# Altium project Task_Tony.PrjPcb (part 7 of 8)

## Sheet 3G_Modem.SchDoc
size A4; DocumentNumber: 11; SheetNumber: 11; SheetTotal: 28
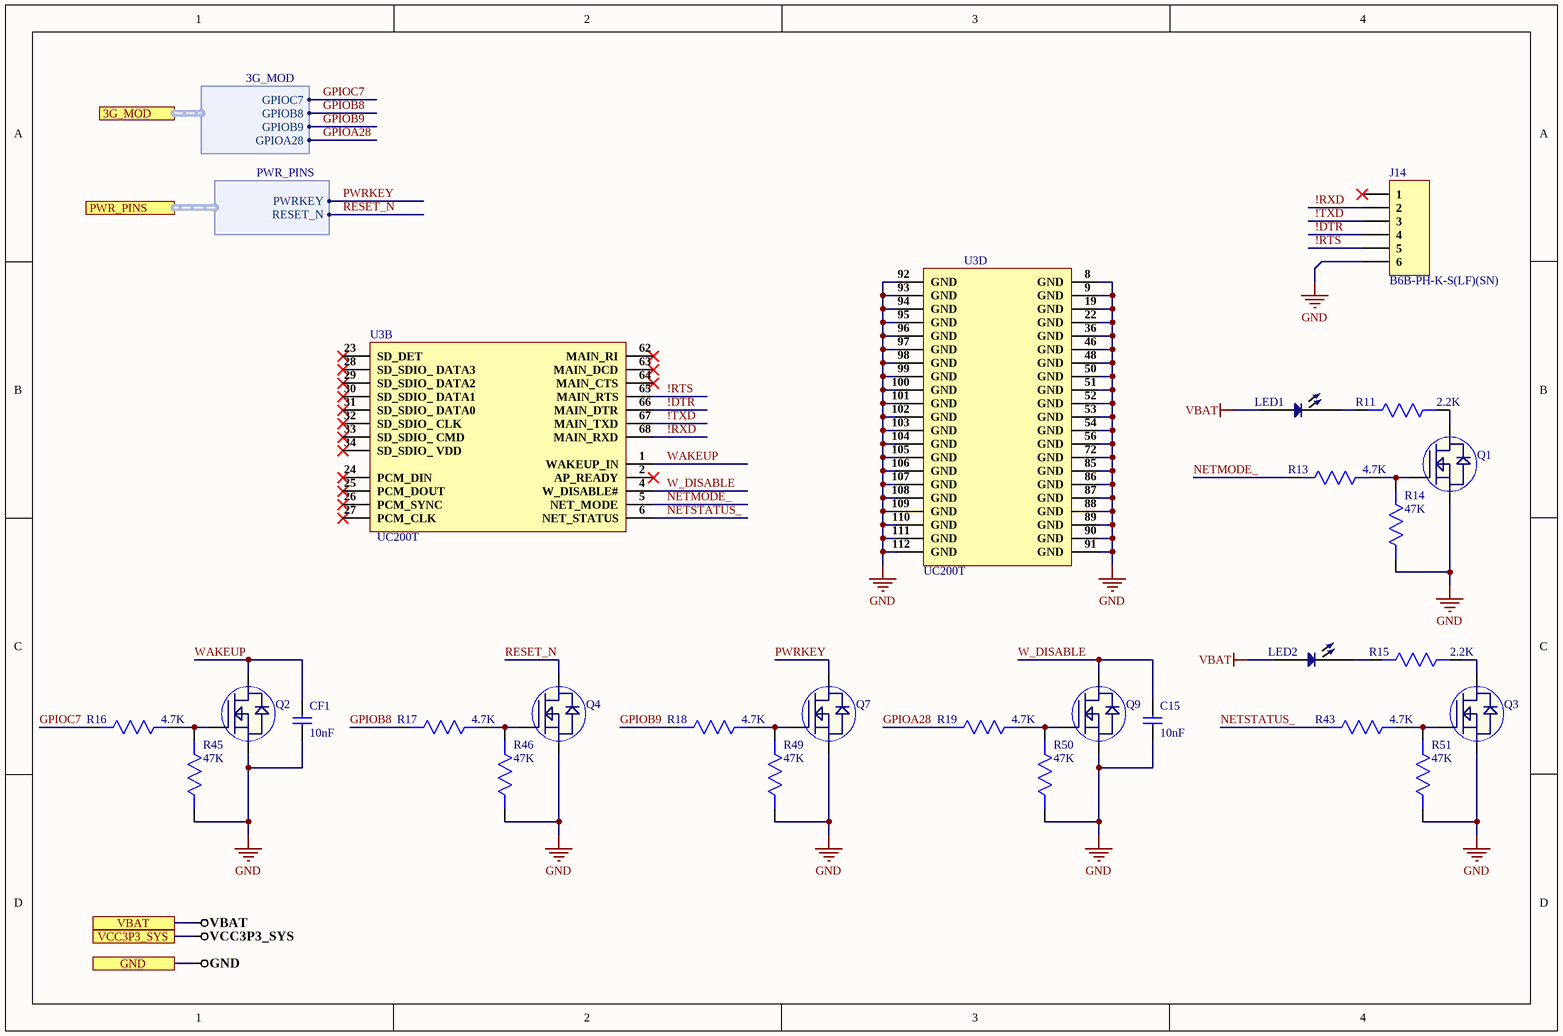
[diagram p27: 3G_Modem.SchDoc]

### Parts
C15  10nF  [Cap0603]
CF1  10nF  [Cap0603]
J14  B6B-PH-K-S(LF)(SN)  [B6B-PH-K-S(LF)(SN)]
LED1  LED Blue  [LED 0402]  (value not drawn)
LED2  LED Blue  [LED 0402]  (value not drawn)
Q1  BSS138LT1G  [SOT23-3]  (value not drawn)
Q2  BSS138LT1G  [SOT23-3]  (value not drawn)
Q3  BSS138LT1G  [SOT23-3]  (value not drawn)
Q4  BSS138LT1G  [SOT23-3]  (value not drawn)
Q7  BSS138LT1G  [SOT23-3]  (value not drawn)
Q9  BSS138LT1G  [SOT23-3]  (value not drawn)
R11  2.2K  [Res0603]
R13  4.7K  [Res0603]
R14  47K  [Res0603]
R15  2.2K  [Res0603]
R16  4.7K  [Res0603]
R17  4.7K  [Res0603]
R18  4.7K  [Res0603]
R19  4.7K  [Res0603]
R43  4.7K  [Res0603]
R45  47K  [Res0603]
R46  47K  [Res0603]
R49  47K  [Res0603]
R50  47K  [Res0603]
R51  47K  [Res0603]
U3  UC200T  [UC200T]  (parts B,D of 4)

### Ports
3G_MOD (harness 3G_MOD), GND, PWR_PINS (harness PWR_PINS), VBAT, VCC3P3_SYS

### Harnesses
PWR_PINS: PWRKEY, RESET_N
3G_MOD: GPIOC7, GPIOB8, GPIOB9, GPIOA28

### Nets
GND: C15.1 CF1.1 J14.6 Q1.2(S) Q2.2(S) Q3.2(S) Q4.2(S) Q7.2(S) Q9.2(S) R14.2 R45.2 R46.2 R49.2 R50.2 R51.2 U3.8(GND) U3.9(GND) U3.19(GND) U3.22(GND) U3.36(GND) U3.46(GND) U3.48(GND) U3.50(GND) U3.51(GND) U3.52(GND) U3.53(GND) U3.54(GND) U3.56(GND) U3.72(GND) U3.85(GND) U3.86(GND) U3.87(GND) U3.88(GND) U3.89(GND) U3.90(GND) U3.91(GND) U3.92(GND) U3.93(GND) U3.94(GND) U3.95(GND) U3.96(GND) U3.97(GND) U3.98(GND) U3.99(GND) U3.100(GND) U3.101(GND) U3.102(GND) U3.103(GND) U3.104(GND) U3.105(GND) U3.106(GND) U3.107(GND) U3.108(GND) U3.109(GND) U3.110(GND) U3.111(GND) U3.112(GND) ; port GND
VBAT: LED1.1 LED2.1 ; port VBAT
!DTR: J14.4 U3.66(MAIN_DTR)
!RTS: J14.5 U3.65(MAIN_RTS)
!RXD: J14.2 U3.68(MAIN_RXD)
!TXD: J14.3 U3.67(MAIN_TXD)
GPIOA28: R19.2 ; port 3G_MOD.GPIOA28  [project net 3G_MOD.GPIOA28]
GPIOB8: R17.2 ; port 3G_MOD.GPIOB8  [project net 3G_MOD.GPIOB8]
GPIOB9: R18.2 ; port 3G_MOD.GPIOB9  [project net 3G_MOD.GPIOB9]
GPIOC7: R16.2 ; port 3G_MOD.GPIOC7  [project net 3G_MOD.GPIOC7]
NETMODE_: R13.2 U3.5(NET_MODE)
NETSTATUS_: R43.2 U3.6(NET_STATUS)
PWRKEY: Q7.3(D) ; port PWR_PINS.PWRKEY
RESET_N: Q4.3(D) ; port PWR_PINS.RESET_N
W_DISABLE: C15.2 Q9.3(D) U3.4(W_DISABLE#)
WAKEUP: CF1.2 Q2.3(D) U3.1(WAKEUP_IN)
NetLED1_2: LED1.2 R11.2
NetLED2_2: LED2.2 R15.2
NetQ1_1: Q1.1(G) R13.1 R14.1
NetQ1_3: Q1.3(D) R11.1
NetQ2_1: Q2.1(G) R16.1 R45.1
NetQ3_1: Q3.1(G) R43.1 R51.1
NetQ3_3: Q3.3(D) R15.1
NetQ4_1: Q4.1(G) R17.1 R46.1
NetQ7_1: Q7.1(G) R18.1 R49.1
NetQ9_1: Q9.1(G) R19.1 R50.1

Not connected (* = marked no-connect by the designer): J14 1*; U3 2(AP_READY)* 23(SD_DET)* 24(PCM_DIN)* 25(PCM_DOUT)* 26(PCM_SYNC)* 27(PCM_CLK)* 28(SD_SDIO__DATA3)* 29(SD_SDIO__DATA2)* 30(SD_SDIO__DATA1)* 31(SD_SDIO__DATA0)* 32(SD_SDIO__CLK)* 33(SD_SDIO__CMD)* 34(SD_SDIO__VDD)* 62(MAIN_RI)* 63(MAIN_DCD)* 64(MAIN_CTS)*

### Library data of the parts
C15 = CC0603KRX7R9BB103: CAP CER 10000PF 50V X7R 0603; Manufacturer: Yageo; Material: Ceramic; Tolerance: 10%; Insulation Resistance: 100GR; Supplier 1: Digi-Key; Manufacturer Part Number: CC0603KRX7R9BB103; Stock 1: 8411467; Pricing 1: 1=0.1, 10=0.038, 100=0.0171, 500=0.01224, 1000=0.00962 (USD); Mount: Surface Mount; Case/Package: 0603; Number of Pins: 2; Case Code (Metric): 1608; Case Code (Imperial): 0603; Min Operating Temperature: -55°C; Max Operating Temperature: 125°C; Capacitance: 10nF; Dielectric: X7R; Voltage: 50V; Packaging: Tape and Reel; Voltage Rating: 50V; Voltage Rating (DC): 50V; Package Quantity: 1; Termination: SMD/SMT; Composition: Ceramic; Length: 1.6mm; Height: 0.8mm; Width: 0.031inch; Thickness: 0.035inch; Depth: 0.8mm; Radiation Hardening: No; REACH SVHC: No SVHC; Lead Free: Lead Free; Halogen Free: Halogen Free; ComponentLink1URL: http://www.farnell.com/datasheets/1734573.pdf?src-supplier=Element14; ComponentLink1Description: http://www.farnell.com/datasheets/1734573.pdf?src-supplier=Element14; ComponentLink2URL: http://www.yageo.com/documents/recent/UPY-GPHC_X7R_6.3V-to-50V_18.pdf?src-supplier=Digi-Key; ComponentLink2Description: http://www.yageo.com/documents/recent/UPY-GPHC_X7R_6.3V-to-50V_18.pdf?src-supplier=Digi-Key; ComponentLink3URL: http://www.farnell.com/datasheets/2167236.pdf?src-supplier=Mouser; ComponentLink3Description: http://www.farnell.com/datasheets/2167236.pdf?src-supplier=Mouser; ComponentLink4URL: http://www.farnell.com/datasheets/70765.pdf?src-supplier=Element14; ComponentLink4Description: http://www.farnell.com/datasheets/70765.pdf?src-supplier=Element14; ComponentLink5URL: http://www.yageo.com/documents/recent/UPY-GPHC_X7R_6.3V-to-50V_8.pdf?src-supplier=Avnet+Europe; ComponentLink5Description: http://www.yageo.com/documents/recent/UPY-GPHC_X7R_6.3V-to-50V_8.pdf?src-supplier=Avnet+Europe; ComponentLink6URL: http://www.farnell.com/datasheets/1489800.pdf?src-supplier=Element14; ComponentLink6Description: http://www.farnell.com/datasheets/1489800.pdf?src-supplier=Element14; ComponentLink7URL: https://www.verical.com/server-webapp/html/getDatasheet?partID=403582&src-supplier=Verical; ComponentLink7Description: https://www.verical.com/server-webapp/html/getDatasheet?partID=403582&src-supplier=Verical; Supplier Part Number 1: 311-1085-6-ND
CF1 = CC0603KRX7R9BB103: CAP CER 10000PF 50V X7R 0603; Manufacturer: Yageo; Tolerance: 10%; Insulation Resistance: 100GR; Supplier 1: Digi-Key; Manufacturer Part Number: CC0603KRX7R9BB103; Stock 1: 8411467; Pricing 1: 1=0.1, 10=0.038, 100=0.0171, 500=0.01224, 1000=0.00962 (USD); Mount: Surface Mount; Case/Package: 0603; Number of Pins: 2; Material: Ceramic; Case Code (Metric): 1608; Case Code (Imperial): 0603; Min Operating Temperature: -55°C; Max Operating Temperature: 125°C; Capacitance: 10nF; Dielectric: X7R; Voltage: 50V; Packaging: Tape and Reel; Voltage Rating: 50V; Voltage Rating (DC): 50V; Package Quantity: 1; Termination: SMD/SMT; Composition: Ceramic; Length: 1.6mm; Height: 0.8mm; Width: 0.031inch; Thickness: 0.035inch; Depth: 0.8mm; Radiation Hardening: No; REACH SVHC: No SVHC; Lead Free: Lead Free; Halogen Free: Halogen Free; ComponentLink1URL: http://www.farnell.com/datasheets/1734573.pdf?src-supplier=Element14; ComponentLink1Description: http://www.farnell.com/datasheets/1734573.pdf?src-supplier=Element14; ComponentLink2URL: http://www.yageo.com/documents/recent/UPY-GPHC_X7R_6.3V-to-50V_18.pdf?src-supplier=Digi-Key; ComponentLink2Description: http://www.yageo.com/documents/recent/UPY-GPHC_X7R_6.3V-to-50V_18.pdf?src-supplier=Digi-Key; ComponentLink3URL: http://www.farnell.com/datasheets/2167236.pdf?src-supplier=Mouser; ComponentLink3Description: http://www.farnell.com/datasheets/2167236.pdf?src-supplier=Mouser; ComponentLink4URL: http://www.farnell.com/datasheets/70765.pdf?src-supplier=Element14; ComponentLink4Description: http://www.farnell.com/datasheets/70765.pdf?src-supplier=Element14; ComponentLink5URL: http://www.yageo.com/documents/recent/UPY-GPHC_X7R_6.3V-to-50V_8.pdf?src-supplier=Avnet+Europe; ComponentLink5Description: http://www.yageo.com/documents/recent/UPY-GPHC_X7R_6.3V-to-50V_8.pdf?src-supplier=Avnet+Europe; ComponentLink6URL: http://www.farnell.com/datasheets/1489800.pdf?src-supplier=Element14; ComponentLink6Description: http://www.farnell.com/datasheets/1489800.pdf?src-supplier=Element14; ComponentLink7URL: https://www.verical.com/server-webapp/html/getDatasheet?partID=403582&src-supplier=Verical; ComponentLink7Description: https://www.verical.com/server-webapp/html/getDatasheet?partID=403582&src-supplier=Verical; Supplier Part Number 1: 311-1085-6-ND
J14 = B6B-PH-K-S(LF)(SN): CONN HEADER VERT 6POS 2MM; Manufacturer: JST; Current Rating: 2A; Number of Positions: 6; Insulation Resistance: 1MR; Working Voltage: 100V; Gender: Male; Contact Resistance: 20mR; Connector Type: Male Pin; Supplier 1: Digi-Key; Manufacturer Part Number: B6B-PH-K-S(LF)(SN); RoHS: Yes; Category: Connectors; Stock 1: 6509; Pricing 1: 1=0.33000, 10=0.31300, 100=0.21940, 500=0.18808, 1000=0.15674, 5000=0.13435, 10000=0.12539 (USD); Mount: Through Hole; Number of Pins: 6; Contact Material: Tin,Brass; Color: Natural; Contact Plating: Tin,Copper; Housing Material: Polyamide; Housing Color: White; Min Operating Temperature: -25°C; Max Operating Temperature: 85°C; Termination: Solder; Fastening Type: Detent; Number of Contacts: 6; Max Voltage Rating (AC): 100V; Number of Rows: 1; Packaging: Bulk; Number of Poles: 6; Voltage Rating (AC): 100V; Max Current Rating: 2A; Voltage Rating: 100V; Orientation: Straight; Length: 13.9mm; Width: 4.5mm; Height: 9.4mm; Pitch: 2mm; Contact Mating Length: 0.13inch; Depth: 4.5mm; Lead Pitch: 2mm; Lead Free: Lead Free; REACH SVHC: No SVHC; ComponentLink1URL: https://datasheet.ciiva.com/11747/0900766b8082f554-11747368.pdf?src-supplier=RSComponents; ComponentLink1Description: https://datasheet.ciiva.com/11747/0900766b8082f554-11747368.pdf?src-supplier=RSComponents; ComponentLink2URL: https://datasheet.ciiva.com/712/eph-712563.pdf?src-supplier=Digi-Key; ComponentLink2Description: https://datasheet.ciiva.com/712/eph-712563.pdf?src-supplier=Digi-Key; ComponentLink3URL: https://datasheet.ciiva.com/26894/getdatasheetpartid-639917-26894487.pdf?src-supplier=Verical; ComponentLink3Description: https://datasheet.ciiva.com/26894/getdatasheetpartid-639917-26894487.pdf?src-supplier=Verical; ComponentLink4URL: https://datasheet.ciiva.com/20207/523648-20207241.pdf?src-supplier=Rapid+Electronics; ComponentLink4Description: https://datasheet.ciiva.com/20207/523648-20207241.pdf?src-supplier=Rapid+Electronics; ComponentLink5URL: https://datasheet.ciiva.com/8052/80560-8052027.pdf?src-supplier=Element14; ComponentLink5Description: https://datasheet.ciiva.com/8052/80560-8052027.pdf?src-supplier=Element14; Supplier Part Number 1: 455-1708-ND
LED1 LED2 = APHHS1005QBC/D: LED BLUE CLEAR CHIP SMD 0402; Manufacturer: Kingbright; Lens Colour: Colorless; Forward Current: 20mA; Forward Voltage: 3.3V; Power Rating: 120mW; Luminous Intensity: 60mcd; Viewing Angle: 120°; Dominant Wavelength: 465nm; Supplier 1: Digi-Key; Manufacturer Part Number: APHHS1005QBC/D; Stock 1: 57149; Pricing 1: 1=0.58, 10=0.42, 25=0.3432, 100=0.2746, 250=0.23168, 500=0.19734, 1000=0.15444 (USD); Mount: Surface Mount; Case/Package: 0402; Colour: Blue; Case Code (Metric): 1005; Case Code (Imperial): 0402; Min Operating Temperature: -40°C; Max Operating Temperature: 85°C; Package Quantity: 2000; Illumination Colour: Blue; Packaging: Tape and Reel; Lens Style: Clear; Lens Transparency: Clear; Test Current: 20mA; Length: 1mm; Height: 0.6mm; Width: 0.5mm; Lead Free: Lead Free; ComponentLink1URL: http://www.mouser.com/ds/2/216/APHHS1005QBC-D-54846.pdf; ComponentLink1Description: http://www.mouser.com/ds/2/216/APHHS1005QBC-D-54846.pdf; ComponentLink2URL: http://www.kingbrightusa.com/images/catalog/SPEC/APHHS1005QBC-D.pdf; ComponentLink2Description: http://www.kingbrightusa.com/images/catalog/SPEC/APHHS1005QBC-D.pdf; Supplier Part Number 1: 754-1504-1-ND
Q1-Q4 Q7 Q9 = BSS138LT1G: MOSFET N-CH 50V 200MA SOT-23; Manufacturer: ON Semiconductor; Gate to Source Voltage (Vgs): 20V; Nominal Vgs: 1.5V; Rds On Max: 3.5R; Input Capacitance: 50pF; Number of Elements: 1; Max Power Dissipation: 225mW; Turn-Off Delay Time: 20ns; Element Configuration: Single; ComponentLink1URL: https://datasheet.ciiva.com/22641/1596366-22641636.pdf; ComponentLink1Description: https://datasheet.ciiva.com/22641/1596366-22641636.pdf; ComponentLink2URL: https://datasheet.ciiva.com/1190/1596366-1190137.pdf; ComponentLink2Description: https://datasheet.ciiva.com/1190/1596366-1190137.pdf; ComponentLink3URL: https://datasheet.ciiva.com/15198/getdatasheetpartid-110266-15198908.pdf; ComponentLink3Description: https://datasheet.ciiva.com/15198/getdatasheetpartid-110266-15198908.pdf; ComponentLink4URL: https://datasheet.ciiva.com/8115/bss138lt1-d-8115295.pdf; ComponentLink4Description: https://datasheet.ciiva.com/8115/bss138lt1-d-8115295.pdf; ComponentLink5URL: https://datasheet.ciiva.com/8115/bss138lt1-d-8115358.pdf; ComponentLink5Description: https://datasheet.ciiva.com/8115/bss138lt1-d-8115358.pdf; ComponentLink6URL: https://datasheet.ciiva.com/1190/1596366-1190136.pdf; ComponentLink6Description: https://datasheet.ciiva.com/1190/1596366-1190136.pdf; ComponentLink7URL: https://datasheet.ciiva.com/936/bss138lt1-d-936802.pdf; ComponentLink7Description: https://datasheet.ciiva.com/936/bss138lt1-d-936802.pdf; ComponentLink8URL: https://datasheet.ciiva.com/936/bss138lt1-d-936801.pdf; ComponentLink8Description: https://datasheet.ciiva.com/936/bss138lt1-d-936801.pdf; ComponentLink9URL: https://datasheet.ciiva.com/14553/70099493-14553829.pdf; ComponentLink9Description: https://datasheet.ciiva.com/14553/70099493-14553829.pdf; ComponentLink10URL: https://datasheet.ciiva.com/936/bss138lt1-d-936803.pdf; ComponentLink10Description: https://datasheet.ciiva.com/936/bss138lt1-d-936803.pdf; Supplier 1: Digi-Key; Manufacturer Part Number: BSS138LT1G; Stock 1: 1283212; Pricing 1: 1=0.27, 10=0.222, 100=0.1177, 500=0.07746, 1000=0.05267 (USD); Case/Package: SOT-23-3; Number of Pins: 3; Contact Plating: Tin,Matte; Min Operating Temperature: -55°C; Max Operating Temperature: 150°C; Continuous Drain Current (ID): 200mA; Package Quantity: 1; Packaging: Tape and Reel; Drain to Source Breakdown Voltage: 50V; Power Dissipation: 225mW; Drain to Source Resistance: 3.5R; Threshold Voltage: 1.5V; Turn-On Delay Time: 20ns; Voltage Rating (DC): 50V; Current Rating: 200mA; On-State Resistance: 3.5R; Length: 3.04mm; Height: 1.01mm; Width: 1.4mm; Radiation Hardening: No; REACH SVHC: No SVHC; Lead Free: Lead Free; Halogen Free: Halogen Free; ComponentLink11URL: http://www.onsemi.com/pub/Collateral/BSS138LT1-D.PDF?src-supplier=Digi-Key; ComponentLink11Description: http://www.onsemi.com/pub/Collateral/BSS138LT1-D.PDF?src-supplier=Digi-Key; ComponentLink12URL: http://www.farnell.com/datasheets/1596366.pdf?src-supplier=Element14; ComponentLink12Description: http://www.farnell.com/datasheets/1596366.pdf?src-supplier=Element14; ComponentLink13URL: http://www.alliedelec.com/m/d/b3c6fd7d92596813fe75d33dcbaaae90.pdf?src-supplier=Allied+Electronics; ComponentLink13Description: http://www.alliedelec.com/m/d/b3c6fd7d92596813fe75d33dcbaaae90.pdf?src-supplier=Allied+Electronics; ComponentLink14URL: https://www.verical.com/server-webapp/html/getDatasheet?partID=110266&src-supplier=Verical; ComponentLink14Description: https://www.verical.com/server-webapp/html/getDatasheet?partID=110266&src-supplier=Verical; ComponentLink15URL: http://www.onsemi.com/pub_link/Collateral/BSS138LT1-D.PDF?src-supplier=Avnet; ComponentLink15Description: http://www.onsemi.com/pub_link/Collateral/BSS138LT1-D.PDF?src-supplier=Avnet; Supplier Part Number 1: BSS138LT1GOSDKR-ND
R11 R15 = RC0603FR-072K2L: RES SMD 2.2K OHM 1% 1/10W 0603; Manufacturer: Yageo Phycomp; Temperature Coefficient: 100ppm/°C; Resistance: 2.2kR; Power Rating: 100mW; Voltage Rating (DC): 50V; Supplier 1: Digi-Key; Manufacturer Part Number: RC0603FR-072K2L; Stock 1: 10587920; Pricing 1: 1=0.1, 10=0.023, 100=0.0094, 1000=0.00421, 2500=0.00366 (USD); Mount: Surface Mount; Case/Package: 0603; Number of Pins: 2; Min Operating Temperature: -55°C; Max Operating Temperature: 155°C; Tolerance: 1%; Packaging: Cut Tape; Length: 1.6mm; Height: 0.45mm; Width: 800um; Depth: 0.8mm; REACH SVHC: No SVHC; Lead Free: Lead Free; Supplier Part Number 1: 311-2.20KHRCT-ND
R13 R16-R19 R43 = RC0603FR-074K7L: RES SMD 4.7K OHM 1% 1/10W 0603; Manufacturer: Yageo; Resistance: 4.7kR; Temperature Coefficient: 100ppm/°C; Power Rating: 100mW; Voltage Rating (DC): 50V; Supplier 1: Digi-Key; Manufacturer Part Number: RC0603FR-074K7L; Stock 1: 5337567; Pricing 1: 1=0.1, 10=0.023, 100=0.0094, 1000=0.00421, 2500=0.00366 (USD); Case/Package: 0603; Number of Pins: 2; Case Code (Imperial): 0603; Case Code (Metric): 1608; Min Operating Temperature: -55°C; Max Operating Temperature: 155°C; Tolerance: 1%; Composition: Thick Film; Packaging: Tape and Reel; Voltage Rating: 50V; Termination: SMD/SMT; Military Standard: Not; Length: 1.6mm; Height: 0.45mm; Width: 0.8mm; Depth: 0.8mm; Lead Pitch: 0.3mm; REACH SVHC: No SVHC; Lead Free: Lead Free; ComponentLink1URL: https://www.verical.com/server-webapp/html/getDatasheet?partID=422754&src-supplier=Verical; ComponentLink1Description: https://www.verical.com/server-webapp/html/getDatasheet?partID=422754&src-supplier=Verical; ComponentLink2URL: http://www.farnell.com/datasheets/2167052.pdf?src-supplier=Element14; ComponentLink2Description: http://www.farnell.com/datasheets/2167052.pdf?src-supplier=Element14; ComponentLink3URL: http://www.farnell.com/datasheets/38590.pdf?src-supplier=Element14; ComponentLink3Description: http://www.farnell.com/datasheets/38590.pdf?src-supplier=Element14; ComponentLink4URL: http://www.farnell.com/datasheets/1868787.pdf?src-supplier=Element14; ComponentLink4Description: http://www.farnell.com/datasheets/1868787.pdf?src-supplier=Element14; Supplier Part Number 1: 311-4.70KHRCT-ND
R14 R45 R46 R49-R51 = RC0603JR-0747KL: RES SMD 47K OHM 5% 1/10W 0603; Manufacturer: Yageo; Resistance: 47kR; Power Rating: 100mW; Voltage Rating (DC): 50V; Temperature Coefficient: 100ppm/°C; Supplier 1: Arrow; Manufacturer Part Number: RC0603JR-0747KL; Stock 1: 599135; Pricing 1: 5000=0.0025, 10000=0.0022, 25000=0.0019, 1=0.0011, 6000=0.001 (USD); Case/Package: 0603; Number of Pins: 2; Case Code (Imperial): 0603; Case Code (Metric): 1608; Min Operating Temperature: -55°C; Max Operating Temperature: 155°C; Packaging: Tape and Reel; Tolerance: 5%; Voltage Rating: 50V; Package Quantity: 5000; Termination: SMD/SMT; Military Standard: Not; Composition: Thick Film; Length: 1.6mm; Height: 0.45mm; Width: 0.8mm; Depth: 0.8mm; REACH SVHC: No SVHC; Lead Free: Lead Free; ComponentLink1URL: http://www.farnell.com/datasheets/443971.pdf; ComponentLink1Description: http://www.farnell.com/datasheets/443971.pdf; ComponentLink2URL: http://www.mouser.com/catalog/specsheets/RC0603.pdf; ComponentLink2Description: http://www.mouser.com/catalog/specsheets/RC0603.pdf; Supplier Part Number 1: RC0603JR-0747KL
U3 = UC200T: UMTS/HSPA+ Module; Manufacturer: Quectel; Value: Custom; Manufacturer Part No: UC200T; Package: Custom

## Sheet Level_Shifter_Sec.SchDoc
size A4; DocumentNumber: 13; SheetNumber: 13; SheetTotal: 28
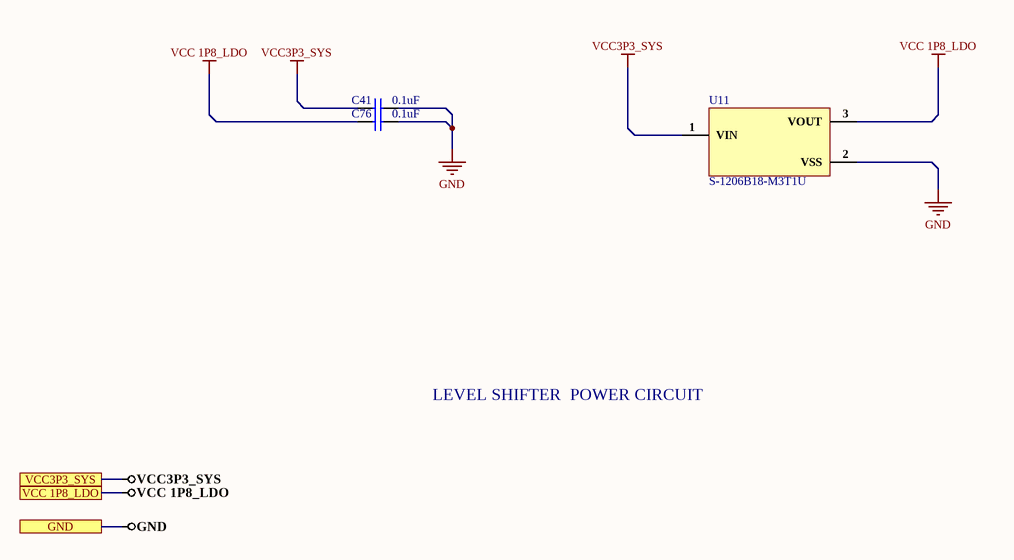
[diagram p28: Level_Shifter_Sec.SchDoc]

### Parts
C41  0.1uF  [Cap0603]
C76  0.1uF  [Cap0603]
U11  S-1206B18-M3T1U  [SOT-23]

### Ports
GND, VCC3P3_SYS, VCC 1P8_LDO

### Nets
GND: C41.2 C76.2 U11.2(VSS) ; port GND
VCC3P3_SYS: C41.1 U11.1(VIN) ; port VCC3P3_SYS  [project net VCC 3P3_SYS]
VCC 1P8_LDO: C76.1 U11.3(VOUT) ; port VCC 1P8_LDO

### Notes on the sheet
- LEVEL SHIFTER  POWER CIRCUIT

### Library data of the parts
C41 C76 = CC0603ZRY5V9BB104: CAP CER 0.1UF 50V Y5V 0603; Manufacturer: Yageo; Capacitance: 100nF; Tolerance: 80%; Supplier 1: Digi-Key; Manufacturer Part Number: CC0603ZRY5V9BB104; Stock 1: 15000880; Pricing 1: 1=0.1, 10=0.075, 100=0.0334, 500=0.02386, 1000=0.01874 (USD); Mount: Surface Mount; Case/Package: 0603; Number of Pins: 2; Case Code (Metric): 1608; Case Code (Imperial): 0603; Min Operating Temperature: -30°C; Max Operating Temperature: 85°C; Dielectric: Y5V; Voltage Rating: 50V; Package Quantity: 1; Packaging: Tape and Reel; Voltage Rating (DC): 50V; Termination: SMD/SMT; Composition: Ceramic; Voltage: 50V; Length: 1.6mm; Height: 0.8mm; Width: 0.031inch; Thickness: 0.035inch; Depth: 0.8mm; Radiation Hardening: No; REACH SVHC: No SVHC; Lead Free: Lead Free; Halogen Free: Halogen Free; ComponentLink1URL: http://www.yageo.com/documents/recent/UPY-GPHC_Y5V_6.3V-to-50V_8.pdf?src-supplier=Digi-Key; ComponentLink1Description: http://www.yageo.com/documents/recent/UPY-GPHC_Y5V_6.3V-to-50V_8.pdf?src-supplier=Digi-Key; ComponentLink2URL: http://www.yageo.com/documents/recent/UPY-GPHC_Y5V_6.3V-to-50V_5.pdf?src-supplier=Avnet+Europe; ComponentLink2Description: http://www.yageo.com/documents/recent/UPY-GPHC_Y5V_6.3V-to-50V_5.pdf?src-supplier=Avnet+Europe; ComponentLink3URL: https://www.verical.com/server-webapp/html/getDatasheet?partID=403611&src-supplier=Verical; ComponentLink3Description: https://www.verical.com/server-webapp/html/getDatasheet?partID=403611&src-supplier=Verical; ComponentLink4URL: http://www.mouser.com/ds/2/447/Yageo_UPY-GP_NP0_16V-to-50V_9-358835.pdf?src-supplier=Mouser; ComponentLink4Description: http://www.mouser.com/ds/2/447/Yageo_UPY-GP_NP0_16V-to-50V_9-358835.pdf?src-supplier=Mouser; ComponentLink5URL: http://www.farnell.com/datasheets/1132289.pdf?src-supplier=Element14; ComponentLink5Description: http://www.farnell.com/datasheets/1132289.pdf?src-supplier=Element14; Supplier Part Number 1: 311-1343-1-ND
U11 = S-1206B18-M3T1U: IC REG LINEAR 1.8V 250MA SOT23-3; Manufacturer: ABLIC; Supplier 1: Digi-Key; Manufacturer Part Number: S-1206B18-M3T1U; Stock 1: 577; Pricing 1: 1=0.92000, 10=0.80800, 25=0.75960, 100=0.57580, 250=0.49000, 500=0.46550 (USD); Supplier Part Number 1: 1662-1438-1-ND

## Sheet RS-232 Tranceiver Section.SchDoc
size A4; DocumentNumber: 19; SheetNumber: 19; SheetTotal: 28
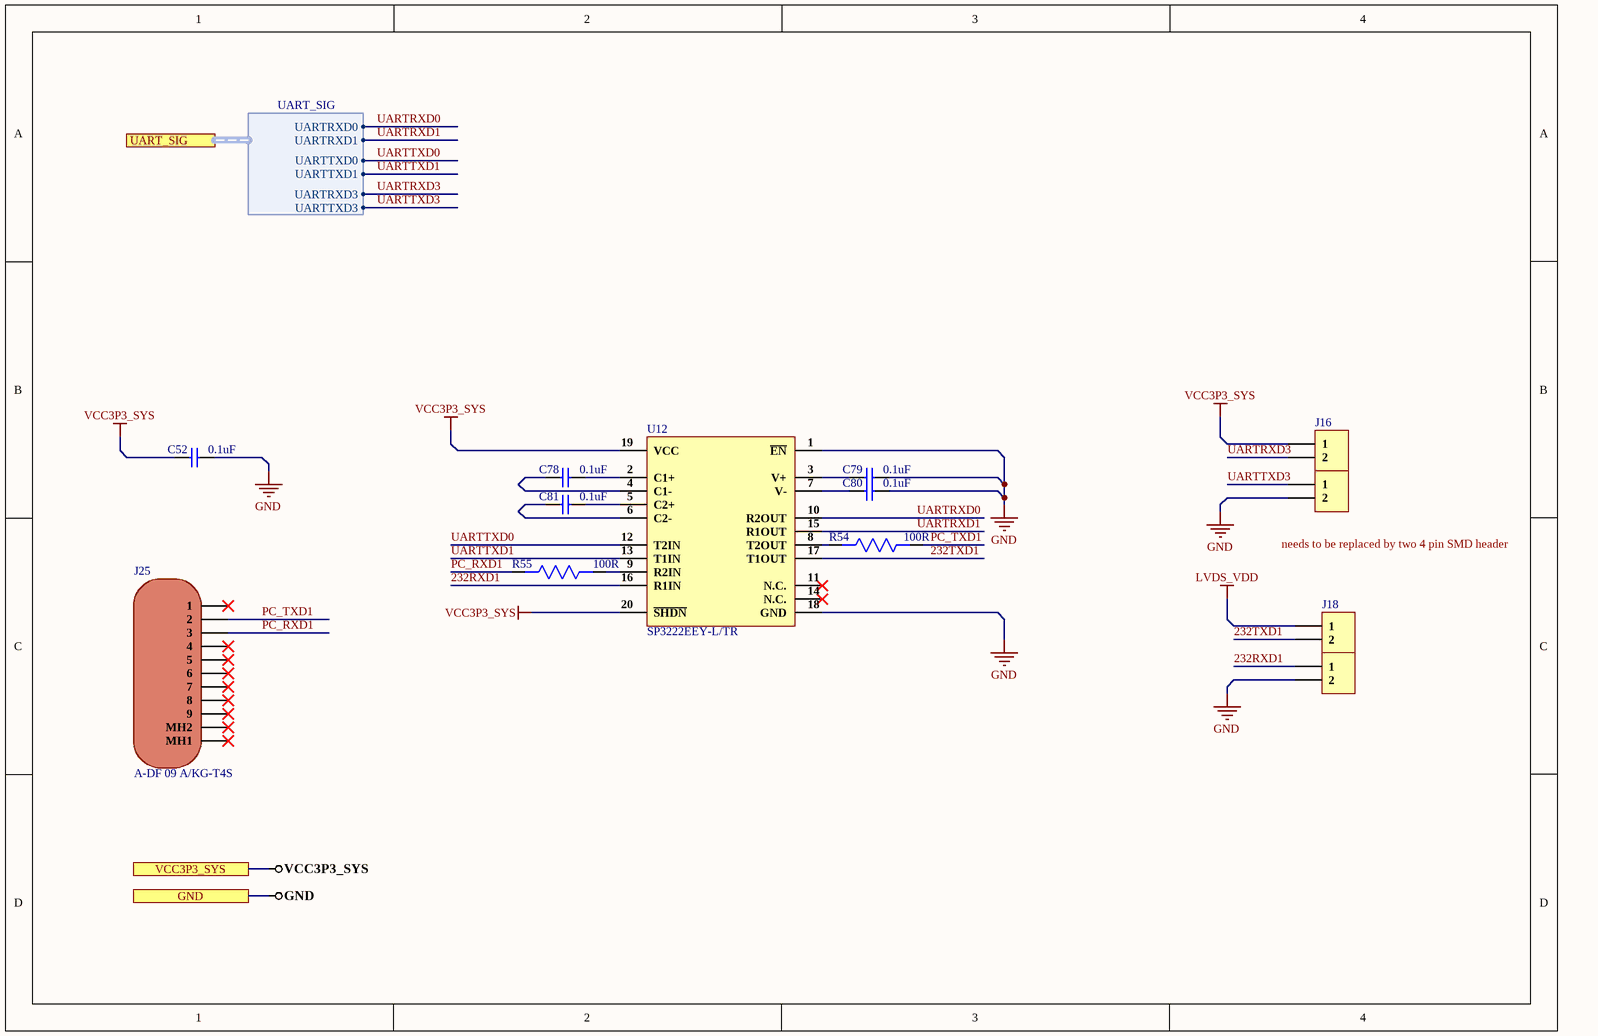
[diagram p29: RS-232 Tranceiver Section.SchDoc]

### Parts
C52  0.1uF  [Cap0603]
C78  0.1uF  [Cap0603]
C79  0.1uF  [Cap0603]
C80  0.1uF  [Cap0603]
C81  0.1uF  [Cap0603]
J16  S2B-XH-A(LF)(SN)  [S2B-XH-A(LF)(SN)]  (value not drawn)
J17  S2B-XH-A(LF)(SN)  [S2B-XH-A(LF)(SN)]  (value not drawn)
J18  S2B-XH-A(LF)(SN)  [S2B-XH-A(LF)(SN)]  (value not drawn)
J19  S2B-XH-A(LF)(SN)  [S2B-XH-A(LF)(SN)]  (value not drawn)
J25  A-DF 09 A/KG-T4S  [A-DF 09 A/KG-T4S]
R54  100R  [Res0603]
R55  100R  [Res0603]
U12  SP3222EEY-L/TR  [20-TSSOP]

### Ports
GND, UART_SIG (harness UART_SIG), VCC3P3_SYS

### Harnesses
UART_SIG: UARTRXD0, UARTRXD1, UARTTXD0, UARTTXD1, UARTRXD3, UARTTXD3

### Nets
GND: C52.2 C79.2 C80.2 J17.2 J19.2 U12.1(~{EN}) U12.18(GND) ; port GND
LVDS_VDD: J18.1
VCC3P3_SYS: C52.1 J16.1 U12.19(VCC) U12.20(~{SHDN}) ; port VCC3P3_SYS  [project net VCC 3P3_SYS]
232RXD1: J19.1 U12.16(R1IN)
232TXD1: J18.2 U12.17(T1OUT)
PC_RXD1: J25.3 R55.2
PC_TXD1: J25.2 R54.1
UARTRXD0: U12.10(R2OUT) ; port UART_SIG.UARTRXD0  [project net UART_SIG.UARTRXD0]
UARTRXD1: U12.15(R1OUT) ; port UART_SIG.UARTRXD1  [project net UART_SIG.UARTRXD1]
UARTRXD3: J16.2 ; port UART_SIG.UARTRXD3  [project net UART_SIG.UARTRXD3]
UARTTXD0: U12.12(T2IN) ; port UART_SIG.UARTTXD0  [project net UART_SIG.UARTTXD0]
UARTTXD1: U12.13(T1IN) ; port UART_SIG.UARTTXD1  [project net UART_SIG.UARTTXD1]
UARTTXD3: J17.1 ; port UART_SIG.UARTTXD3  [project net UART_SIG.UARTTXD3]
NetC78_1: C78.1 U12.4(C1-)
NetC78_2: C78.2 U12.2(C1+)
NetC79_1: C79.1 U12.3(V+)
NetC80_1: C80.1 U12.7(V-)
NetC81_1: C81.1 U12.6(C2-)
NetC81_2: C81.2 U12.5(C2+)
NetR54_2: R54.2 U12.8(T2OUT)
NetR55_1: R55.1 U12.9(R2IN)

Not connected (* = marked no-connect by the designer): J25 1* 4* 5* 6* 7* 8* 9* MH1* MH2*; U12 11(N.C.)* 14(N.C.)*

### Notes on the sheet
- (near J17) needs to be replaced by two 4 pin SMD header

### Library data of the parts
C52 C78-C81 = CC0603ZRY5V9BB104: as C41 on sheet Level_Shifter_Sec; Supplier 1: Digi-Key; Manufacturer Part Number: CC0603ZRY5V9BB104; Stock 1: 15000880; Pricing 1: 1=0.1, 10=0.075, 100=0.0334, 500=0.02386, 1000=0.01874 (USD); Mount: Surface Mount; Case/Package: 0603; Number of Pins: 2; Case Code (Metric): 1608; Case Code (Imperial): 0603; Min Operating Temperature: -30°C; Max Operating Temperature: 85°C; Dielectric: Y5V; Voltage Rating: 50V; Package Quantity: 1; Packaging: Tape and Reel; Voltage Rating (DC): 50V; Termination: SMD/SMT; Composition: Ceramic; Voltage: 50V; Length: 1.6mm; Height: 0.8mm; Width: 0.031inch; Thickness: 0.035inch; Depth: 0.8mm; Radiation Hardening: No; REACH SVHC: No SVHC; Lead Free: Lead Free; Halogen Free: Halogen Free; ComponentLink1URL: http://www.yageo.com/documents/recent/UPY-GPHC_Y5V_6.3V-to-50V_8.pdf?src-supplier=Digi-Key; ComponentLink1Description: http://www.yageo.com/documents/recent/UPY-GPHC_Y5V_6.3V-to-50V_8.pdf?src-supplier=Digi-Key; ComponentLink2URL: http://www.yageo.com/documents/recent/UPY-GPHC_Y5V_6.3V-to-50V_5.pdf?src-supplier=Avnet+Europe; ComponentLink2Description: http://www.yageo.com/documents/recent/UPY-GPHC_Y5V_6.3V-to-50V_5.pdf?src-supplier=Avnet+Europe; ComponentLink3URL: https://www.verical.com/server-webapp/html/getDatasheet?partID=403611&src-supplier=Verical; ComponentLink3Description: https://www.verical.com/server-webapp/html/getDatasheet?partID=403611&src-supplier=Verical; ComponentLink4URL: http://www.mouser.com/ds/2/447/Yageo_UPY-GP_NP0_16V-to-50V_9-358835.pdf?src-supplier=Mouser; ComponentLink4Description: http://www.mouser.com/ds/2/447/Yageo_UPY-GP_NP0_16V-to-50V_9-358835.pdf?src-supplier=Mouser; ComponentLink5URL: http://www.farnell.com/datasheets/1132289.pdf?src-supplier=Element14; ComponentLink5Description: http://www.farnell.com/datasheets/1132289.pdf?src-supplier=Element14; Supplier Part Number 1: 311-1343-1-ND
J16-J19 = S2B-XH-A(LF)(SN): CONN HEADER R/A 2POS 2.5MM; Manufacturer: JST; Current Rating: 3A; Contact Resistance: 20mR; Voltage Rating (AC): 250V; Number of Positions: 2; Insulation Resistance: 1GR; Gender: Male; Connector Type: Male Pin; Wire/Cable Gauge: 22AWG; Supplier 1: Digi-Key; Manufacturer Part Number: S2B-XH-A(LF)(SN); RoHS: Yes; Category: Headers and Wire Housings; Stock 1: 44898; Pricing 1: 1=0.17000, 10=0.16200, 100=0.11260, 500=0.09524, 1000=0.07792, 5000=0.06927, 10000=0.06277 (USD); Mount: Through Hole; Contact Material: Brass; Contact Plating: Tin,Copper,Lead; Color: Natural; Housing Color: White; Housing Material: Polyamide; Min Operating Temperature: -25°C; Max Operating Temperature: 85°C; Number of Rows: 1; Voltage Rating: 250V; Termination: Press-Fit; Number of Contacts: 2; Max Current Rating: 3A; Package Quantity: 1000; Packaging: Bulk; Max Voltage Rating (AC): 250V; Max Voltage Rating (DC): 250V; Orientation: Right Angle; Length: 7.4mm; Pitch: 2.5mm; Lead Pitch: 2.5mm; Depth: 11.5mm; REACH SVHC: No SVHC; Lead Free: Lead Free; ComponentLink1URL: https://datasheet.ciiva.com/16208/s2b-xh-alfsn-16208978.pdf?src-supplier=Future+Electronics; ComponentLink1Description: https://datasheet.ciiva.com/16208/s2b-xh-alfsn-16208978.pdf?src-supplier=Future+Electronics; ComponentLink2URL: https://datasheet.ciiva.com/8052/1684882-8052211.pdf?src-supplier=Element14; ComponentLink2Description: https://datasheet.ciiva.com/8052/1684882-8052211.pdf?src-supplier=Element14; ComponentLink3URL: https://datasheet.ciiva.com/11746/0900766b8082f560-11746947.pdf?src-supplier=RSComponents; ComponentLink3Description: https://datasheet.ciiva.com/11746/0900766b8082f560-11746947.pdf?src-supplier=RSComponents; ComponentLink4URL: https://datasheet.ciiva.com/26894/getdatasheetpartid-640270-26894603.pdf?src-supplier=Verical; ComponentLink4Description: https://datasheet.ciiva.com/26894/getdatasheetpartid-640270-26894603.pdf?src-supplier=Verical; ComponentLink5URL: https://datasheet.ciiva.com/26924/getdatasheetpartid-645395-26924076.pdf?src-supplier=Verical; ComponentLink5Description: https://datasheet.ciiva.com/26924/getdatasheetpartid-645395-26924076.pdf?src-supplier=Verical; ComponentLink6URL: https://datasheet.ciiva.com/26894/getdatasheetpartid-441330-26894909.pdf?src-supplier=Verical; ComponentLink6Description: https://datasheet.ciiva.com/26894/getdatasheetpartid-441330-26894909.pdf?src-supplier=Verical; ComponentLink7URL: https://datasheet.ciiva.com/726/exh-726412.pdf?src-supplier=Digi-Key; ComponentLink7Description: https://datasheet.ciiva.com/726/exh-726412.pdf?src-supplier=Digi-Key; ComponentLink8URL: https://datasheet.ciiva.com/20207/523653-20207183.pdf?src-supplier=Rapid+Electronics; ComponentLink8Description: https://datasheet.ciiva.com/20207/523653-20207183.pdf?src-supplier=Rapid+Electronics; Supplier Part Number 1: 455-2257-ND
J25 = A-DF 09 A/KG-T4S: CONN D-SUB RCPT 9POS R/A SOLDER; Manufacturer: Assmann; Connector Type: D-Sub,Receptacle,Signal; Number of Positions: 9; Voltage Rating: 250V; Current Rating: 3A; Supplier 1: Digi-Key; Manufacturer Part Number: A-DF 09 A/KG-T4S; RoHS: Yes; Category: D-Sub Connectors; Stock 1: 19005; Pricing 1: 1=0.79000, 10=0.74200, 25=0.66800, 50=0.59380, 100=0.56910, 250=0.51964, 500=0.49490, 1000=0.40829, 2500=0.37118 (USD); Mount: Through Hole; Number of Pins: 9; Housing Material: PBT; Color: Black; Contact Plating: Gold; Contact Material: Copper Alloy; Min Operating Temperature: -55°C; Max Operating Temperature: 105°C; Packaging: Tray; Number of Rows: 2; Termination: Solder; Lead Free: Lead Free; Flammability Rating: UL94 V-0; ComponentLink1URL: http://www.assmann-wsw.com/fileadmin/datasheets/ASS_4888_CO.pdf?src-supplier=Digi-Key; ComponentLink1Description: http://www.assmann-wsw.com/fileadmin/datasheets/ASS_4888_CO.pdf?src-supplier=Digi-Key; Supplier Part Number 1: AE10924-ND
R54 R55 = RC0603FR-07100RL: RES SMD 100 OHM 1% 1/10W 0603; Manufacturer: Yageo; Temperature Coefficient: 100ppm/°C; Voltage Rating (DC): 50V; Power Rating: 100mW; Supplier 1: Arrow Electronics; Manufacturer Part Number: RC0603FR-07100RL; RoHS: Yes; Category: Chip SMD Resistors; Stock 1: 3800000; Pricing 1: 5000=0.00300, 5000=0.00200, 5000=0.00450, 50000=0.00410, 500000=0.00230, 2500000=0.00140 (USD); Case/Package: 0603; Number of Pins: 2; Case Code (Imperial): 0603; Case Code (Metric): 1608; Size Code: 0603; Min Operating Temperature: -55°C; Max Operating Temperature: 155°C; Resistance: 100R; Tolerance: 1%; Resistor Type: Thick Film; Packaging: Tape and Reel; Voltage Rating: 50V; Termination: SMD/SMT; Features: Moisture Resistant; Series: RC; Max Power Dissipation: 100mW; Number of Terminations: 2; Construction: Rectangular; Resistance Tolerance: 1%; Technology: THICK FILM; Length: 1.6mm; Width: 0.8mm; Height: 0.45mm; Depth: 0.8mm; REACH SVHC: Unknown; Lead Free: Lead Free; RoHS Compliant: Yes; Military Standard: Not; Supplier Part Number 1: RC0603FR-07100RL
U12 = SP3222EEY-L/TR: IC TRANSCEIVER FULL 2/2 20TSSOP; Manufacturer: MaxLinear; Supplier 1: Digi-Key; Manufacturer Part Number: SP3222EEY-L/TR; RoHS: Yes; Category: Interface ICs; Stock 1: 1669; Pricing 1: 1=1.75000, 10=1.57600, 25=1.48680, 100=1.26660, 250=1.18932, 500=1.04066, 1000=0.86226 (USD); RoHS Compliant: Yes; Supplier Part Number 1: 1016-1794-1-ND

## Sheet BLE&WiFi_Section.SchDoc
size A4
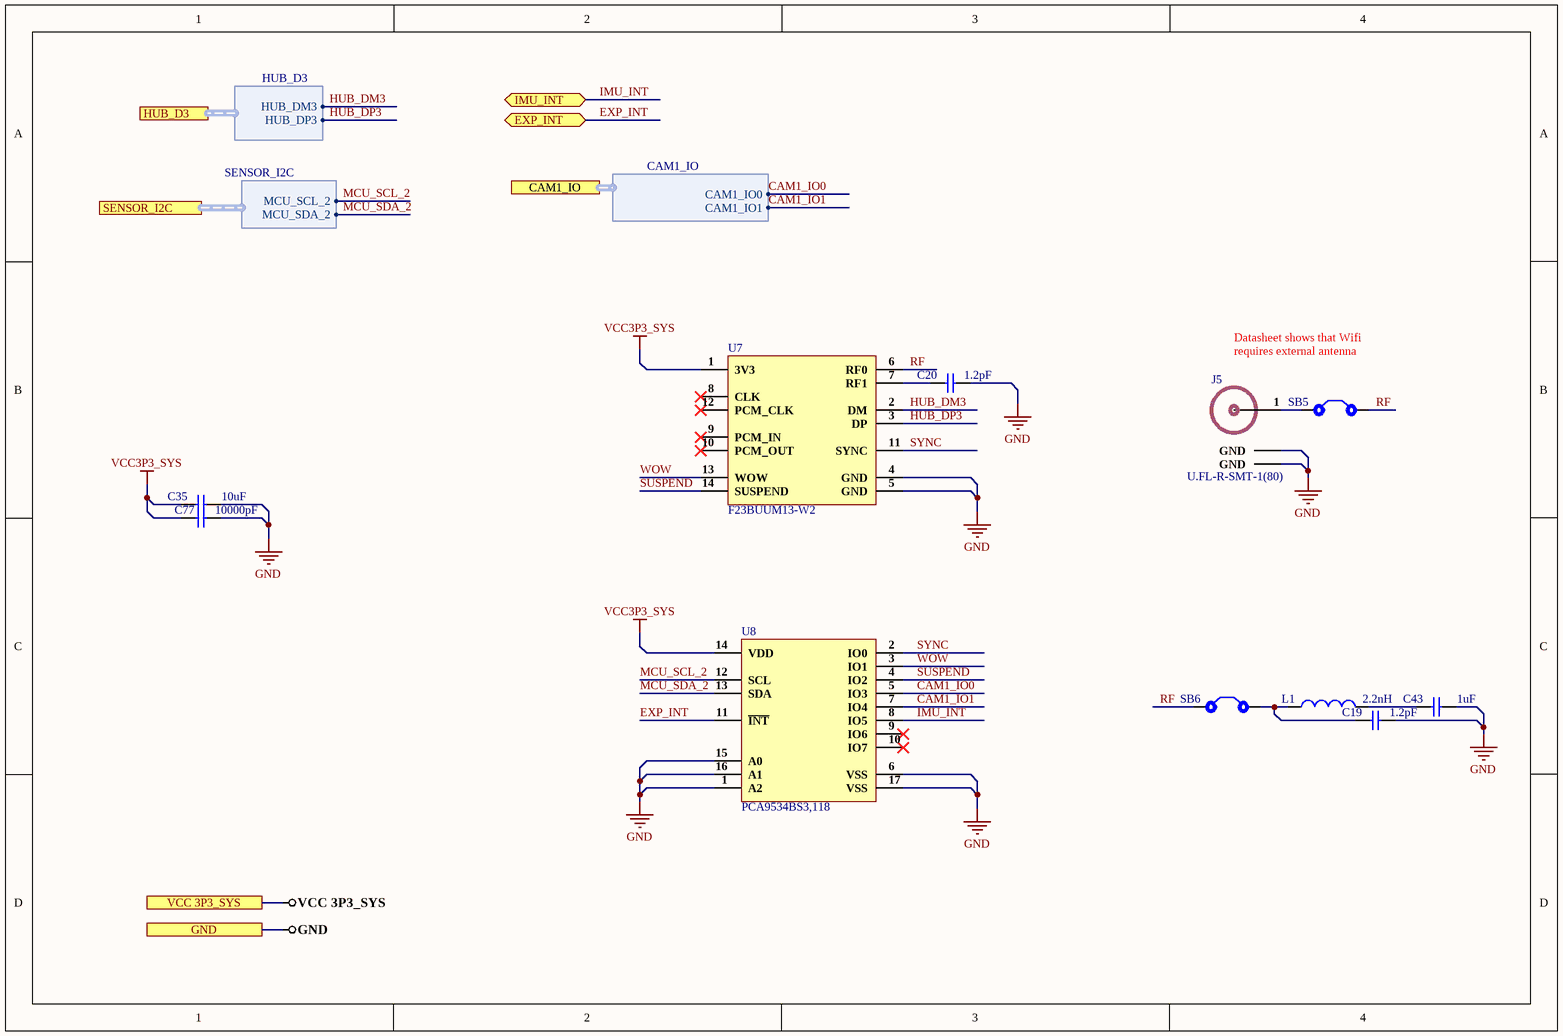
[diagram p30: BLE&WiFi_Section.SchDoc]

### Parts
C19  1.2pF  [Cap0603]
C20  1.2pF  [Cap0603]
C35  10uF  [Cap0603]
C43  1uF  [Cap0603]
C77  10000pF  [Cap0603]
J5  U.FL-R-SMT-1(80)  [U.FL-R-SMT-1(80)]
L1  2.2nH  [IND 0402]
SB5  Solder Bridge  [Solder Bridge]  (value not drawn)
SB6  Solder Bridge  [Solder Bridge]  (value not drawn)
U7  F23BUUM13-W2  [F23BUUM13-W2]
U8  PCA9534BS3,118  [16HVQFN]

### Ports
CAM1_IO (harness CAM1_IO), EXP_INT (bidir), GND, HUB_D3 (harness HUB_D3), IMU_INT (bidir), SENSOR_I2C (harness SENSOR_I2C), VCC 3P3_SYS

### Harnesses
HUB_D3: HUB_DM3, HUB_DP3
SENSOR_I2C: MCU_SCL_2, MCU_SDA_2
CAM1_IO: CAM1_IO0, CAM1_IO1

### Nets
GND: C19.2 C20.2 C35.2 C43.2 C77.2 J5.2(GND) J5.3(GND) U7.4(GND) U7.5(GND) U8.1(A2) U8.6(VSS) U8.15(A0) U8.16(A1) U8.17(VSS) ; port GND
VCC 3P3_SYS: C35.1 C77.1 U7.1(3V3) U8.14(VDD) ; port VCC 3P3_SYS  [also labelled VCC3P3_SYS]
CAM1_IO0: U8.5(IO3) ; port CAM1_IO.CAM1_IO0  [project net CAM1_IO.CAM1_IO0]
CAM1_IO1: U8.7(IO4) ; port CAM1_IO.CAM1_IO1  [project net CAM1_IO.CAM1_IO1]
EXP_INT: U8.11(~{INT}) ; port EXP_INT
HUB_DM3: U7.2(DM) ; port HUB_D3.HUB_DM3  [project net HUB_D3.HUB_DM3]
HUB_DP3: U7.3(DP) ; port HUB_D3.HUB_DP3  [project net HUB_D3.HUB_DP3]
IMU_INT: U8.8(IO5) ; port IMU_INT
MCU_SCL_2: U8.12(SCL) ; port SENSOR_I2C.MCU_SCL_2
MCU_SDA_2: U8.13(SDA) ; port SENSOR_I2C.MCU_SDA_2
RF: SB5.2 SB6.1 U7.6(RF0)
SUSPEND: U7.14(SUSPEND) U8.4(IO2)
SYNC: U7.11(SYNC) U8.2(IO0)
WOW: U7.13(WOW) U8.3(IO1)
NetC19_1: C19.1 L1.1 SB6.2
NetC20_1: C20.1 U7.7(RF1)
NetC43_1: C43.1 L1.2
NetJ5_1: J5.1(RF_IN) SB5.1

Not connected (* = marked no-connect by the designer): U7 8(CLK)* 9(PCM_IN)* 10(PCM_OUT)* 12(PCM_CLK)*; U8 9(IO6)* 10(IO7)*

### Notes on the sheet
- Datasheet shows that Wifi requires external antenna

### Library data of the parts
C19 C20 = CC0603BRNPO9BN1R2: CAP 1.2pF 50V, 0603; Manufacturer: Yageo; Dielectric: C0G; Supplier 1: Mouser; Manufacturer Part Number: CC0603BRNPO9BN1R2; RoHS: Yes; Category: Ceramic Capacitors; Stock 1: 8000; Pricing 1: 1=0.14000, 10=0.08500, 50=0.08500, 100=0.03800, 1000=0.02100, 10000=0.01500 (USD); Mount: Surface Mount; Case/Package: 0603; Case Code (Imperial): 0603; Case Code (Metric): 1608; Min Operating Temperature: -55°C; Max Operating Temperature: 125°C; Packaging: Tape and Reel; Capacitance: 1.2pF; Voltage Rating: 50V; Package Quantity: 4000; Voltage Rating (DC): 50V; Termination: SMD/SMT; Resistor Type: Ceramic; Series: CC; Length: 1.6mm; Width: 0.031inch; Thickness: 0.035inch; Depth: 0.8mm; Radiation Hardening: No; Lead Free: Lead Free; RoHS Compliant: Yes; ComponentLink1URL: https://datasheet.ciiva.com/26862/getdatasheetpartid-403487-26862671.pdf?src-supplier=Verical; ComponentLink1Description: https://datasheet.ciiva.com/26862/getdatasheetpartid-403487-26862671.pdf?src-supplier=Verical; ComponentLink2URL: https://datasheet.ciiva.com/13210/upy-gp-np0-16v-to-50v-8-13210853.pdf?src-supplier=Mouser; ComponentLink2Description: https://datasheet.ciiva.com/13210/upy-gp-np0-16v-to-50v-8-13210853.pdf?src-supplier=Mouser; ComponentLink3URL: https://datasheet.ciiva.com/11586/upy-gp-np0-16v-to-50v-8-11586536.pdf?src-supplier=Avnet; ComponentLink3Description: https://datasheet.ciiva.com/11586/upy-gp-np0-16v-to-50v-8-11586536.pdf?src-supplier=Avnet; ComponentLink4URL: https://datasheet.ciiva.com/17437/upy-gp-np0-16v-to-50v-8-17437548.pdf?src-supplier=Avnet+Europe; ComponentLink4Description: https://datasheet.ciiva.com/17437/upy-gp-np0-16v-to-50v-8-17437548.pdf?src-supplier=Avnet+Europe; Supplier Part Number 1: 603-CC603BRNPO9BN1R2
C35 = GRM188R6YA106MA73D: CAP CER 10UF 35V X5R 0603; Manufacturer: Murata; Tolerance: 20%; Supplier 1: Digi-Key; Manufacturer Part Number: GRM188R6YA106MA73D; Stock 1: 11640; Pricing 1: 1=0.5, 10=0.346, 100=0.2076, 500=0.1557, 1000=0.13148 (USD); Mount: Surface Mount; Case/Package: 0603; Case Code (Metric): 1608; Case Code (Imperial): 0603; Min Operating Temperature: -55°C; Max Operating Temperature: 85°C; Packaging: Tape and Reel; Capacitance: 10uF; Voltage Rating: 35V; Voltage Rating (DC): 35V; Dielectric: X5R; Length: 0.063inch; Width: 0.031inch; Thickness: 0.039inch; ComponentLink1URL: http://search.murata.co.jp/Ceramy/image/img/A01X/G101/ENG/GRM188R6YA106MA73-01.pdf?src-supplier=Digi-Key; ComponentLink1Description: http://search.murata.co.jp/Ceramy/image/img/A01X/G101/ENG/GRM188R6YA106MA73-01.pdf?src-supplier=Digi-Key; ComponentLink2URL: http://search.murata.co.jp/Ceramy/image/img/A01X/G101/ENG/GRM188R6YA106MA73-01.pdf?src-supplier=Mouser; ComponentLink2Description: http://search.murata.co.jp/Ceramy/image/img/A01X/G101/ENG/GRM188R6YA106MA73-01.pdf?src-supplier=Mouser; ComponentLink3URL: https://www.murata.com/~/media/webrenewal/support/library/catalog/products/capacitor/mlcc/c02e.ashx?la=en-us&src-supplier=Digi-Key; ComponentLink3Description: https://www.murata.com/~/media/webrenewal/support/library/catalog/products/capacitor/mlcc/c02e.ashx?la=en-us&src-supplier=Digi-Key; ComponentLink4URL: http://search.murata.co.jp/Ceramy/image/img/A01X/G101/ENG/GRM188R6YA106MA73-01.pdf?src-supplier=Future+Electronics; ComponentLink4Description: http://search.murata.co.jp/Ceramy/image/img/A01X/G101/ENG/GRM188R6YA106MA73-01.pdf?src-supplier=Future+Electronics; ComponentLink5URL: http://search.murata.co.jp/Ceramy/image/img/A01X/G101/ENG/GRM188R6YA106MA73-01.pdf?src-supplier=TTI; ComponentLink5Description: http://search.murata.co.jp/Ceramy/image/img/A01X/G101/ENG/GRM188R6YA106MA73-01.pdf?src-supplier=TTI; Supplier Part Number 1: 490-13248-6-ND
C43 = CC0603KRX5R8BB105: CAP CER 1UF 25V X5R 0603; Manufacturer: Yageo; Tolerance: 10%; Supplier 1: Digi-Key; Manufacturer Part Number: CC0603KRX5R8BB105; Stock 1: 459947; Pricing 1: 1=0.1, 10=0.076, 100=0.0337, 500=0.0241, 1000=0.01894 (USD); Mount: Surface Mount; Case/Package: 0603; Number of Pins: 2; Case Code (Metric): 1608; Case Code (Imperial): 0603; Min Operating Temperature: -55°C; Max Operating Temperature: 85°C; Capacitance: 1uF; Dielectric: X5R; Package Quantity: 1; Voltage Rating: 25V; Packaging: Tape and Reel; Termination: SMD/SMT; Voltage Rating (DC): 25V; Length: 1.6mm; Height: 0.8mm; Width: 0.031inch; Thickness: 0.035inch; Depth: 0.8mm; Radiation Hardening: No; REACH SVHC: No SVHC; Lead Free: Lead Free; Halogen Free: Halogen Free; ComponentLink1URL: http://www.yageo.com/documents/recent/UPY-GPHC_X5R_4V-to-50V_25.pdf?src-supplier=Digi-Key; ComponentLink1Description: http://www.yageo.com/documents/recent/UPY-GPHC_X5R_4V-to-50V_25.pdf?src-supplier=Digi-Key; ComponentLink2URL: http://www.yageo.com/documents/recent/UPY-GPHC_X5R_4V-to-50V_12.pdf?src-supplier=Avnet+Europe; ComponentLink2Description: http://www.yageo.com/documents/recent/UPY-GPHC_X5R_4V-to-50V_12.pdf?src-supplier=Avnet+Europe; ComponentLink3URL: http://www.farnell.com/datasheets/1525783.pdf?src-supplier=Element14; ComponentLink3Description: http://www.farnell.com/datasheets/1525783.pdf?src-supplier=Element14; ComponentLink4URL: http://www.yageo.com/documents/recent/UPY-GPHC_X5R_4V-to-50V_12.pdf?src-supplier=Avnet; ComponentLink4Description: http://www.yageo.com/documents/recent/UPY-GPHC_X5R_4V-to-50V_12.pdf?src-supplier=Avnet; Supplier Part Number 1: 311-1445-1-ND
C77 = CC0603KRX7R9BB103: CAP CER 10000PF 50V X7R 0603; Manufacturer: Yageo; Material: Ceramic; Tolerance: 10%; Capacitance: 10nF; Insulation Resistance: 100GR; Supplier 1: Digi-Key; Manufacturer Part Number: CC0603KRX7R9BB103; Stock 1: 8411467; Pricing 1: 1=0.1, 10=0.038, 100=0.0171, 500=0.01224, 1000=0.00962 (USD); Mount: Surface Mount; Case/Package: 0603; Number of Pins: 2; Case Code (Metric): 1608; Case Code (Imperial): 0603; Min Operating Temperature: -55°C; Max Operating Temperature: 125°C; Dielectric: X7R; Voltage: 50V; Packaging: Tape and Reel; Voltage Rating: 50V; Voltage Rating (DC): 50V; Package Quantity: 1; Termination: SMD/SMT; Composition: Ceramic; Length: 1.6mm; Height: 0.8mm; Width: 0.031inch; Thickness: 0.035inch; Depth: 0.8mm; Radiation Hardening: No; REACH SVHC: No SVHC; Lead Free: Lead Free; Halogen Free: Halogen Free; ComponentLink1URL: http://www.farnell.com/datasheets/1734573.pdf?src-supplier=Element14; ComponentLink1Description: http://www.farnell.com/datasheets/1734573.pdf?src-supplier=Element14; ComponentLink2URL: http://www.yageo.com/documents/recent/UPY-GPHC_X7R_6.3V-to-50V_18.pdf?src-supplier=Digi-Key; ComponentLink2Description: http://www.yageo.com/documents/recent/UPY-GPHC_X7R_6.3V-to-50V_18.pdf?src-supplier=Digi-Key; ComponentLink3URL: http://www.farnell.com/datasheets/2167236.pdf?src-supplier=Mouser; ComponentLink3Description: http://www.farnell.com/datasheets/2167236.pdf?src-supplier=Mouser; ComponentLink4URL: http://www.farnell.com/datasheets/70765.pdf?src-supplier=Element14; ComponentLink4Description: http://www.farnell.com/datasheets/70765.pdf?src-supplier=Element14; ComponentLink5URL: http://www.yageo.com/documents/recent/UPY-GPHC_X7R_6.3V-to-50V_8.pdf?src-supplier=Avnet+Europe; ComponentLink5Description: http://www.yageo.com/documents/recent/UPY-GPHC_X7R_6.3V-to-50V_8.pdf?src-supplier=Avnet+Europe; ComponentLink6URL: http://www.farnell.com/datasheets/1489800.pdf?src-supplier=Element14; ComponentLink6Description: http://www.farnell.com/datasheets/1489800.pdf?src-supplier=Element14; ComponentLink7URL: https://www.verical.com/server-webapp/html/getDatasheet?partID=403582&src-supplier=Verical; ComponentLink7Description: https://www.verical.com/server-webapp/html/getDatasheet?partID=403582&src-supplier=Verical; Supplier Part Number 1: 311-1085-6-ND
J5 = U.FL-R-SMT-1(80): CONN U.FL RCPT STR 50 OHM SMD; Manufacturer: Hirose; Supplier 1: Future Electronics; Manufacturer Part Number: U.FL-R-SMT-1(80); Stock 1: 1272; Pricing 1: 1=1.07, 500=0.785, 1500=0.74, 2500=0.72, 5000=0.695 (USD); Case/Package: SMD/SMT; Package Quantity: 10000; Packaging: Tape and Reel; Lead Free: Lead Free; ComponentLink1URL: https://www.hirose.com/product/en/download_file/key_name/U.FL-R-SMT-1%2880%29/category/Specification%20Sheet/doc_file_id/37638/?file_category_id=9&item_id=03310472280&is_series=&src-supplier=Digi-Key; ComponentLink1Description: https://www.hirose.com/product/en/download_file/key_name/U.FL-R-SMT-1%2880%29/category/Specification%20Sheet/doc_file_id/37638/?file_category_id=9&item_id=03310472280&is_series=&src-supplier=Digi-Key; ComponentLink2URL: http://www.mouser.com/ds/2/185/U.FL_catalog-939761.pdf?src-supplier=Mouser; ComponentLink2Description: http://www.mouser.com/ds/2/185/U.FL_catalog-939761.pdf?src-supplier=Mouser; Supplier Part Number 1: U.FL-R-SMT-1(80)-CUTT
L1 = BSCH001005052N2SCP: FIXED IND 2.2NH 400MA 120 MOHM; Manufacturer: Chilisin; Supplier 1: Digi-Key; Manufacturer Part Number: BSCH001005052N2SCP; RoHS: Yes; Stock 1: 6911; Pricing 1: 1=0.10000, 10=0.01800, 25=0.01600, 50=0.01420, 100=0.01210, 250=0.01072, 500=0.00982, 1000=0.00839, 2500=0.00750 (USD); Supplier Part Number 1: 2184-BSCH001005052N2SCPCT-ND
SB5 SB6 = Solder Bridge: Solder Bridge ON
U7 = F23BUUM13-W2: Realtek RTL8723BU Combo Module
U8 = PCA9534BS3,118: NXP - PCA9534BS3,118 - I/O EXPANDER, 8BIT, 400KHZ, HVQFN-16; Manufacturer: NXP Semiconductors; Interface: I2C,SMBus,Serial; Output Current: 50mA; Number of I/Os: 8; Max Power Dissipation: 200mW; Operating Supply Voltage: 5.5V; Supplier 1: Digi-Key; Manufacturer Part Number: PCA9534BS3,118; RoHS: Yes; Category: Interface ICs; Stock 1: 1204; Pricing 1: 1=1.61000, 10=1.48200 (USD); Mount: Surface Mount; Number of Pins: 16; Min Operating Temperature: -40°C; Max Operating Temperature: 85°C; Package Quantity: 1; Packaging: Tape and Reel; Frequency: 400kHz; Max Frequency: 400kHz; Series: -; Lead Free: Lead Free; RoHS Compliant: Yes; ComponentLink1URL: https://datasheet.ciiva.com/1780/pca9534-1780006.pdf?src-supplier=Digi-Key; ComponentLink1Description: https://datasheet.ciiva.com/1780/pca9534-1780006.pdf?src-supplier=Digi-Key; ComponentLink2URL: https://datasheet.ciiva.com/1780/pca9534-1780007.pdf?src-supplier=Digi-Key; ComponentLink2Description: https://datasheet.ciiva.com/1780/pca9534-1780007.pdf?src-supplier=Digi-Key; ComponentLink3URL: https://datasheet.ciiva.com/1780/pca9534-1780008.pdf?src-supplier=Digi-Key; ComponentLink3Description: https://datasheet.ciiva.com/1780/pca9534-1780008.pdf?src-supplier=Digi-Key; Supplier Part Number 1: 568-8706-1-ND